# Altium schematic sheet LORAPROJ_2.SchDoc
size A; SheetNumber: 2; SheetTotal: 3
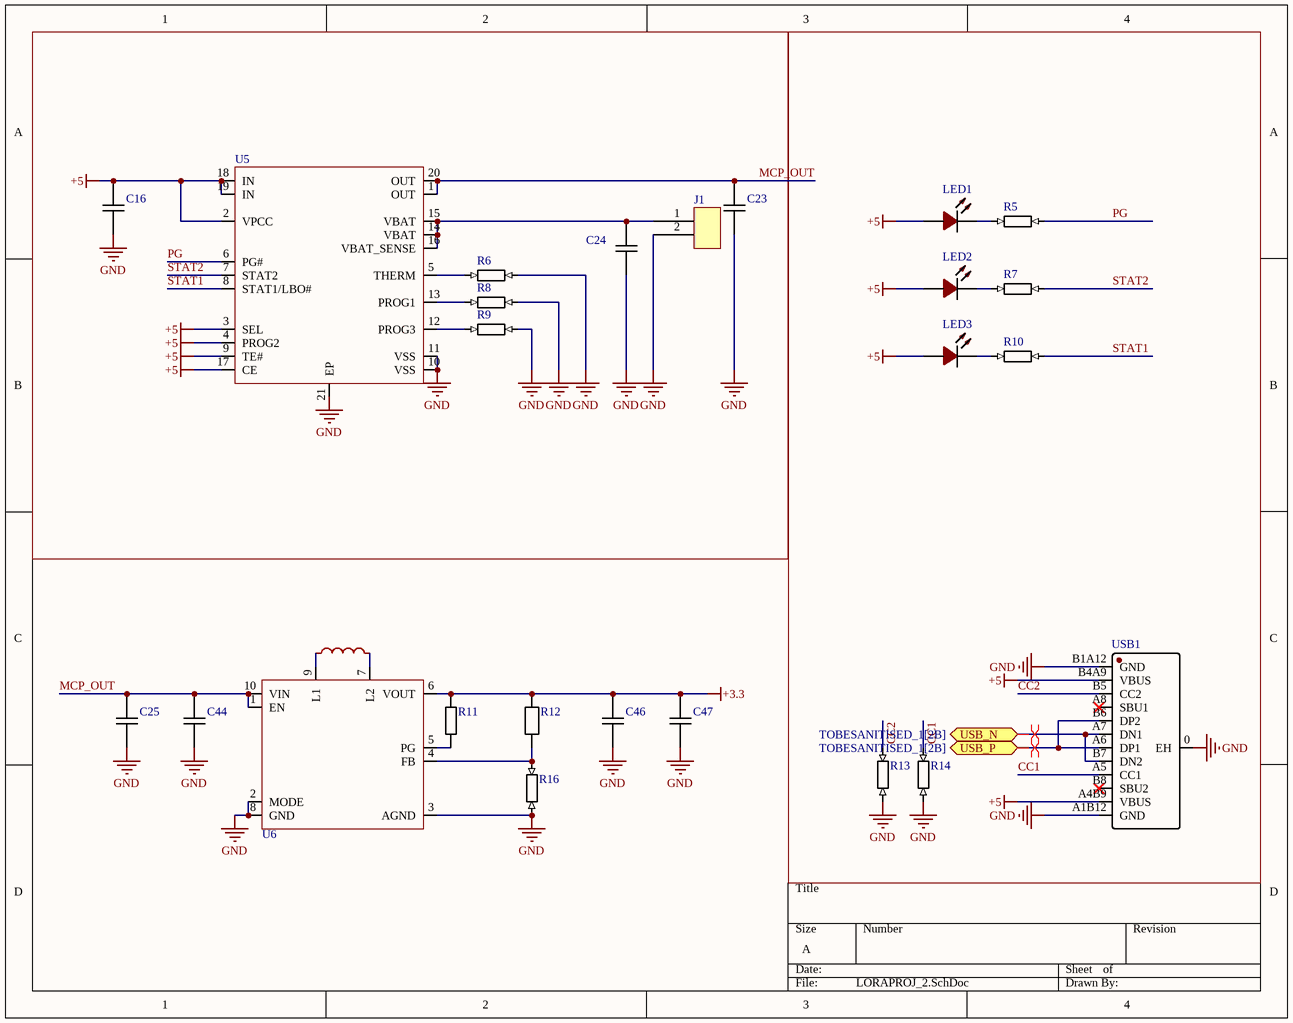
[diagram p0: LORAPROJ_2.SchDoc]

## Parts
C16  (no value)  [CAP_0603]
C23  (no value)  [CAP_0603]
C24  (no value)  [CAP_0603]
C25  (no value)  [CAP_0603]
C44  (no value)  [CAP_0603]
C46  (no value)  [CAP_0603]
C47  (no value)  [CAP_0603]
J1  (no value)  [2.0 2P-Footprint-1]
L14  (no value)  [Inductor]
LED1  (no value)  [LED_0603]
LED2  (no value)  [LED_0603]
LED3  (no value)  [LED_0603]
R5  (no value)  [RES_0603]
R6  (no value)  [RES_0603]
R7  (no value)  [RES_0603]
R8  (no value)  [RES_0603]
R9  (no value)  [RES_0603]
R10  (no value)  [RES_0603]
R11  (no value)  [RES_0603]
R12  (no value)  [RES_0603]
R13  (no value)  [RES_0603]
R14  (no value)  [RES_0603]
R16  (no value)  [RES_0603]
U5  (no value)  [QFN-20_4x4_P0.5_EP]
U6  (no value)  [VSON-10_3x2_P0.5]
USB1  (no value)  [USB-C_SMD_16P]

## Ports
USB_N (bidir, see TOBESANITISED_1[2B]), USB_P (bidir, see TOBESANITISED_1[2B])

## Nets
+3.3: C46.2 C47.2 R11.2 R12.2 U6.6(VOUT)
+5: C16.2 LED1.2(A) LED2.2(A) LED3.2(A) U5.2(VPCC) U5.3(SEL) U5.4(PROG2) U5.9(TE#) U5.17(CE) U5.18(IN) U5.19(IN) USB1.A4B9(VBUS) USB1.B4A9(VBUS)
GND: C16.1 C23.1 C24.1 C25.1 C44.1 C46.1 C47.1 J1.2 R6.2 R8.2 R9.2 R13.1 R14.1 R16.1 U5.10(VSS) U5.11(VSS) U5.21(EP) U6.2(MODE) U6.3(AGND) U6.8(GND) USB1.0(EH) USB1.A1B12(GND) USB1.B1A12(GND)
CC1: R14.2 USB1.A5(CC1)
CC2: R13.2 USB1.B5(CC2)
MCP_OUT: C23.2 C25.2 C44.2 U5.1(OUT) U5.20(OUT) U6.1(EN) U6.10(VIN)
PG: R5.2 U5.6(PG#)
STAT1: R10.2 U5.8(STAT1/LBO#)
STAT2: R7.2 U5.7(STAT2)
USB_N: USB1.A7(DN1) USB1.B7(DN2) ; port USB_N
USB_P: USB1.A6(DP1) USB1.B6(DP2) ; port USB_P
NetC24_2: C24.2 J1.1 U5.14(VBAT) U5.15(VBAT) U5.16(VBAT_SENSE)
NetL14_1: L14.1 U6.9(L1)
NetL14_2: L14.2 U6.7(L2)
NetLED1_1: LED1.1(C) R5.1
NetLED2_1: LED2.1(C) R7.1
NetLED3_1: LED3.1(C) R10.1
NetR6_1: R6.1 U5.5(THERM)
NetR8_1: R8.1 U5.13(PROG1)
NetR9_1: R9.1 U5.12(PROG3)
NetR11_1: R11.1 U6.5(PG)
NetR12_1: R12.1 R16.2 U6.4(FB)

Not connected (* = marked no-connect by the designer): USB1 A8(SBU1)* B8(SBU2)*

## Layout directives
differential pair: USB_N, USB_P

## Library data of the parts
C16 C23-C25 C44 C46 C47 = CAP: Package: CAP_0603
J1 = CONN
L14 = IND: AddInBom: yes; ConvertToPcb: yes
LED1-LED3 = LED: Package: LED_0603
R5-R14 R16 = RES: Package: RES_0603
U5 = IC_U5: Package: QFN-20_4x4_P0.5_EP
U6 = IC_U6: Package: VSON-10_3x2_P0.5
USB1 = CONN_USB_C: Package: USB-C_SMD_16P